# Altium project lga1700.PrjPCB (part 11 of 11)
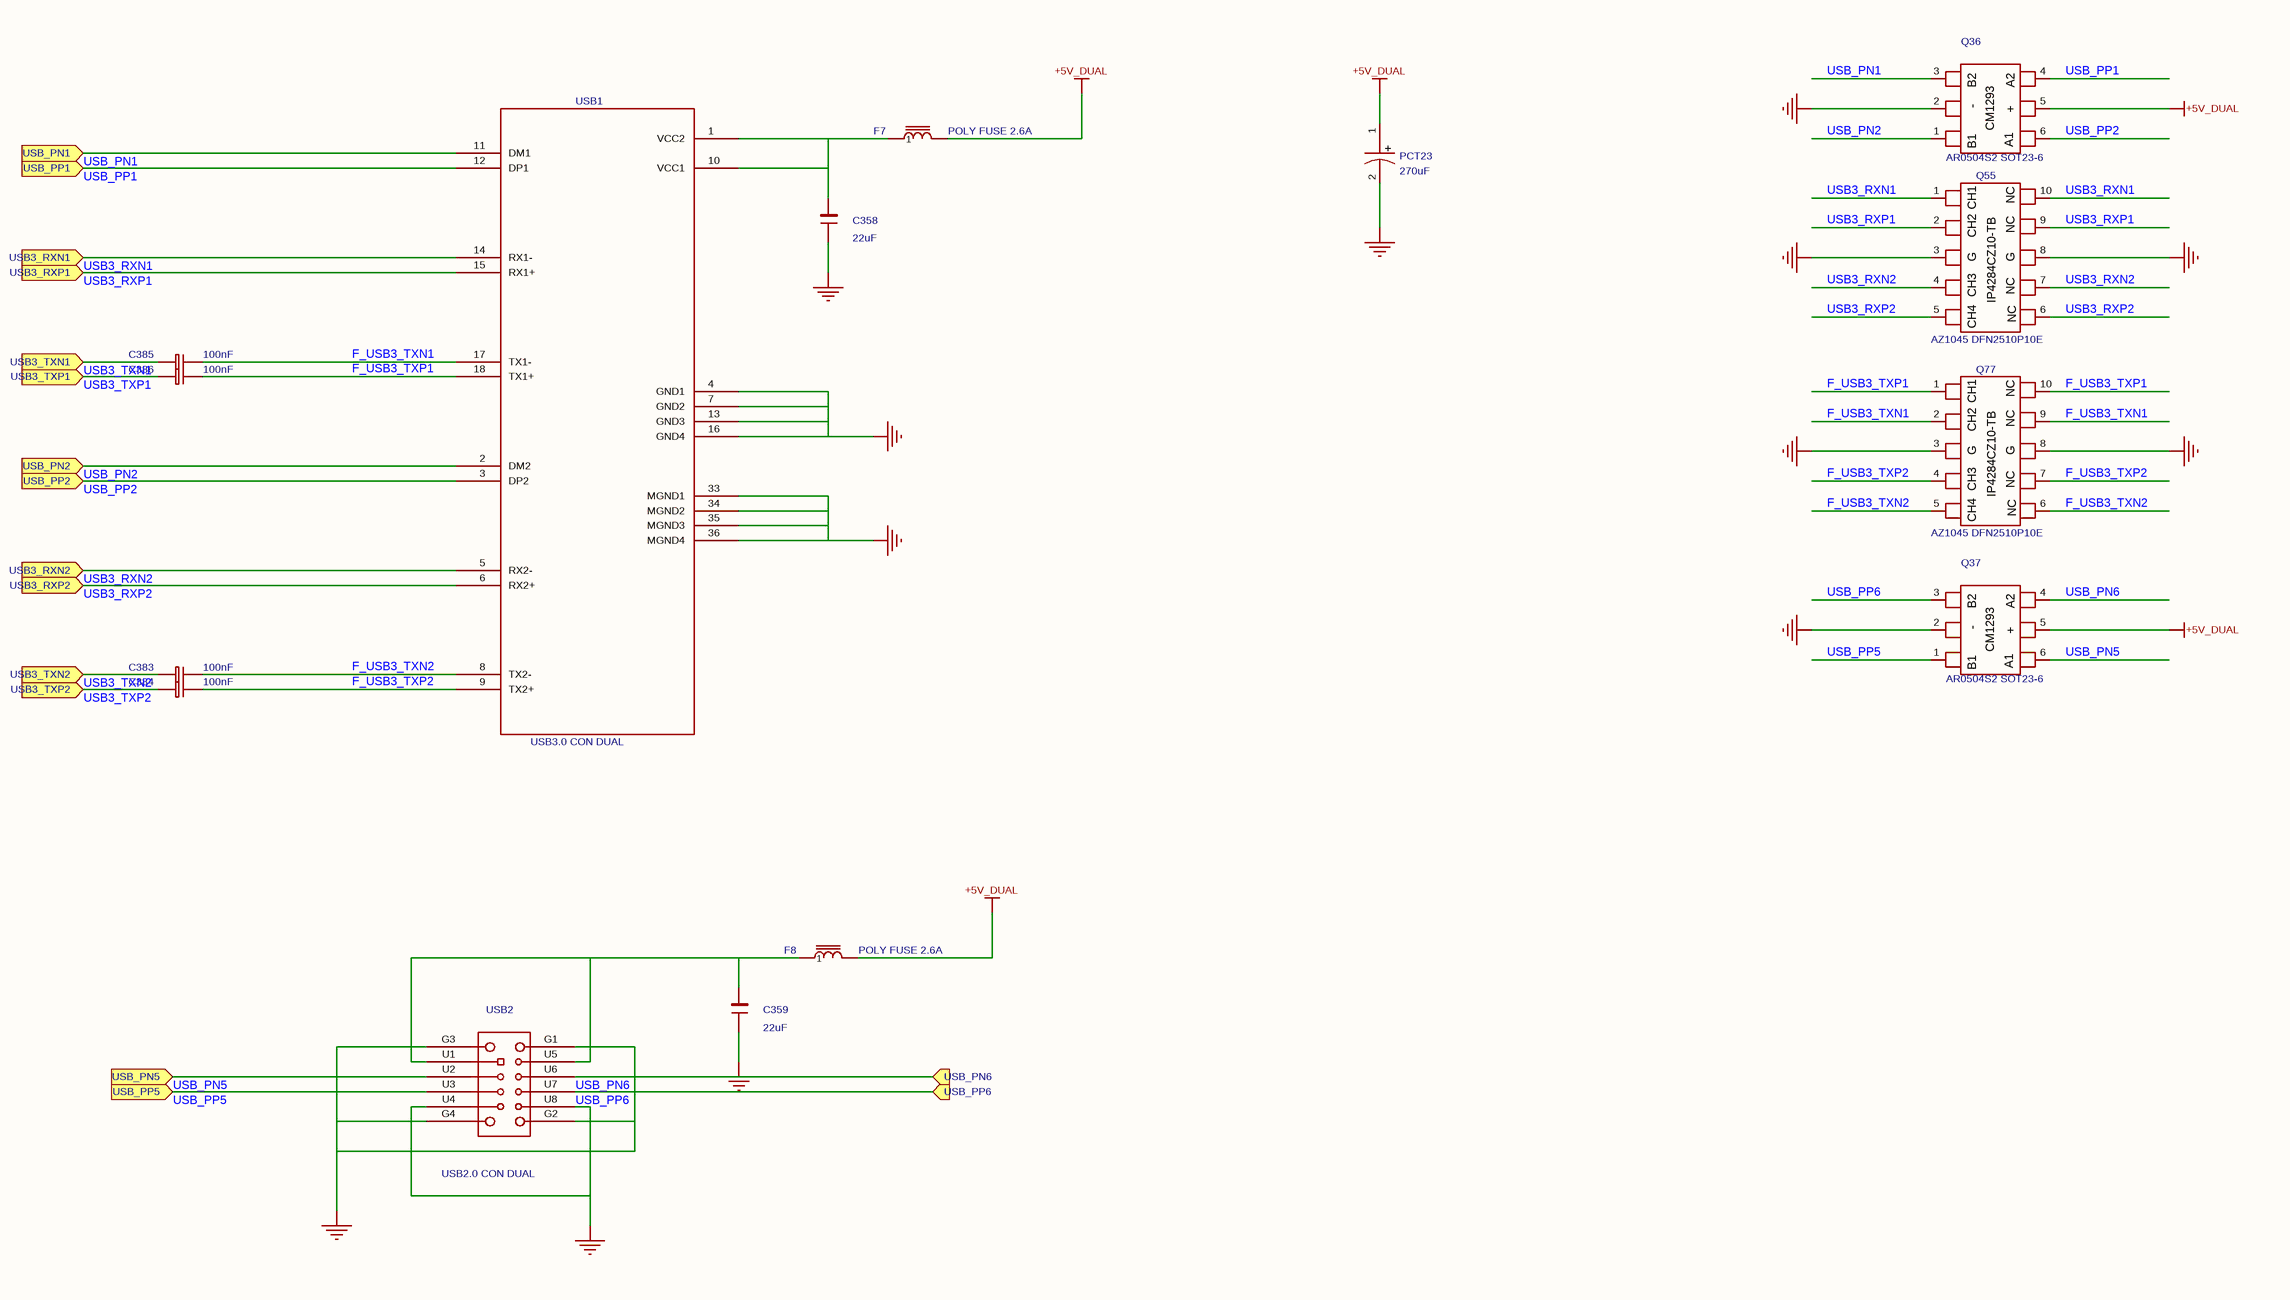
[diagram p134: USB32 GEN1 5G_REAR.schdoc]

## Nets that join several sheets
+3V3_DUAL: 5V_DUAL (5 pins), ADL S PCH 600 PWR (17 pins), ADL S PCH 600 SPI_PM (9 pins), ADL S PCH 600 STRAP (7 pins), DDR4_PWR - +VDDQ_+VTT_+VPP (6 pins), LAN - RTL8111H (LR1.1), PCH_PWR - 0.82V_1.05V_1.8V (8 pins), POWER - SYSTEM POWER (R209.1 R217.1 R218.1 R593.2), SIO - IT8613E (11 pins), SIO - IT8784E (R139.1 R172.1 R194.1 R305.1)
+5V_DUAL: 5V_DUAL (10 pins), CPU_PWR - 1.8V_1.05V (R371.1), CPU_PWR - VCCIN_AUX (R392.2), DDR4_PWR - +VDDQ_+VTT_+VPP (12 pins), PCH_PWR - 0.82V_1.05V_1.8V (6 pins), PEG_PCIEX1 SLOT (C245.1 PR193.1 PU9.3 PU9.4), POWER - SYSTEM POWER (C107.1), SIO - IT8613E (SR31.1), USB32 GEN1 5G_FRONT (7 pins), USB32 GEN1 5G_REAR (5 pins)
+5V_STBY: 5V_DUAL (D2.1 D5.1 R87.1), POWER - SYSTEM POWER (ATXPWR1.9 ECT6.1 FC5.1 R115.1)
+V3.3A_RTC: ADL S PCH 600 PWR (6 pins), ADL S PCH 600 SPI_PM (5 pins), SIO - IT8613E (C273.2 SU3.29)
+VCC1P05_PROC: ADL S PCH 600 SPI_PM (YR39.2 YR42.2 YR43.2), CPU_PWR - 1.8V_1.05V (6 pins)
+VCCCORE: CPU_PWR - +VCCCORE_1_3 (11 pins), CPU_PWR - +VCCCORE_2_3 (PL12.2 PL13.2 PR40.2 PR45.2), CPU_PWR - +VCCCORE_3_3 (PL14.2 PR52.2), SIO - IT8613E (SR28.1)
+VCCPRIM_1P05V: ADL S PCH 600 PWR (BYC4.1 PCH2.AD15), ADL S PCH 600 STRAP (YR86.1), PCH_PWR - 0.82V_1.05V_1.8V (C382.1 R375.2 U12.5)
+VCCPRIM_1P8V: ADL S PCH 600 PWR (9 pins), ADL S PCH 600 STRAP (YR87.2), PCH_PWR - 0.82V_1.05V_1.8V (5 pins), SIO - IT8613E (SR38.1)
+VCCPRIM_P82V: ADL S PCH 600 PWR (55 pins), PCH_PWR - 0.82V_1.05V_1.8V (MCT12.1 PL20.2 PR183.2 TR38.2)
+VPP: DDR4_PWR - +VDDQ_+VTT_+VPP (5 pins), DDR4_UDIMM CHANNEL-A0 (7 pins), DDR4_UDIMM CHANNEL-B0 (7 pins)
+VTT: DDR4_PWR - +VDDQ_+VTT_+VPP (C496.1 PU5.4), DDR4_UDIMM CHANNEL-A0 (C77.1 C78.1 DIMMA1.77 DIMMA1.221), DDR4_UDIMM CHANNEL-B0 (C91.1 C92.1 DIMMB1.77 DIMMB1.221)
GND: 5V_DUAL (9 pins), ADL S PCH 600 CLOCK_PCIE (6 pins), ADL S PCH 600 PWR (30 pins), ADL S PCH 600 SPI_PM (28 pins), ADL S PCH 600 STRAP (YR84.1 YR187.2), AUDIO - ALC897_3CH (11 pins), COM (13 pins), CPU_PWR - +VCCCORE_1_3 (25 pins), CPU_PWR - +VCCCORE_2_3 (18 pins), CPU_PWR - +VCCCORE_3_3 (9 pins), CPU_PWR - +VCCGT (11 pins), CPU_PWR - 1.8V_1.05V (18 pins), CPU_PWR - VCCIN_AUX (16 pins), DDR4_PWR - +VDDQ_+VTT_+VPP (34 pins), DDR4_UDIMM CHANNEL-A0 (117 pins), DDR4_UDIMM CHANNEL-B0 (113 pins), DISPLAY - HDMI 2.0 (17 pins), LAN - RTL8111H (24 pins), M.2_SATA_SLOT (40 pins), PCH_PWR - 0.82V_1.05V_1.8V (26 pins), PEG_PCIEX1 SLOT (91 pins), POWER - SYSTEM POWER (122 pins), SIO - IT8613E (10 pins), SIO - IT8784E (6 pins), USB32 GEN1 5G_FRONT (21 pins), USB32 GEN1 5G_REAR (23 pins)
V12MOS: CPU_PWR - +VCCCORE_1_3 (8 pins), CPU_PWR - +VCCCORE_2_3 (8 pins), CPU_PWR - +VCCCORE_3_3 (PC181.2 PCT11.1 PQ15.5 PR230.1), CPU_PWR - +VCCGT (PC184.2 PCT12.1 PQ17.5 PR231.1), CPU_PWR - VCCIN_AUX (MCT20.1 PC32.2 PQ28.5)
V_SM: DDR4_PWR - +VDDQ_+VTT_+VPP (9 pins), DDR4_UDIMM CHANNEL-A0 (47 pins), DDR4_UDIMM CHANNEL-B0 (45 pins), SIO - IT8613E (SR40.1)
VCC3_3: ADL S PCH 600 CLOCK_PCIE (R53.1 R54.1 R56.1), AUDIO - ALC897_3CH (AFB8.1 R276.2), CPU_PWR - 1.8V_1.05V (7 pins), CPU_PWR - VCCIN_AUX (R393.2 R610.1 R611.1), DDR4_PWR - +VDDQ_+VTT_+VPP (R551.1), DDR4_UDIMM CHANNEL-A0 (C79.1 DIMMA1.284), DDR4_UDIMM CHANNEL-B0 (C93.1 DIMMB1.284 R29.1), DISPLAY - HDMI 2.0 (7 pins), LAN - RTL8111H (LR4.1), M.2_SATA_SLOT (19 pins), PEG_PCIEX1 SLOT (8 pins), POWER - SYSTEM POWER (11 pins), SIO - IT8613E (8 pins), SIO - IT8784E (R140.1 R337.1)
VCC5: 5V_DUAL (ECT11.1 PQ19.1 PQ19.2 PQ19.3), AUDIO - ALC897_3CH (AFB1.1 AFB9.1), COM (R794.1 SU4.20), CPU_PWR - 1.8V_1.05V (PC28.2 PC31.2 PU3.4 PU4.4), CPU_PWR - VCCIN_AUX (MR110.2), DISPLAY - HDMI 2.0 (PD3.2), POWER - SYSTEM POWER (6 pins), SIO - IT8613E (SR36.1)
VCC12: 5V_DUAL (R73.1), COM (C635.2 CPU_FAN.2 R788.1 SU4.1), PEG_PCIEX1 SLOT (13 pins), POWER - SYSTEM POWER (ATXPWR1.10 ATXPWR1.11 FC1.1), SIO - IT8613E (SR30.1)
VCC12-: COM (SU4.10), POWER - SYSTEM POWER (ATXPWR1.14)
1P05_PROC_PGD: CPU_PWR - 1.8V_1.05V (PR17.1 PU4.1), CPU_PWR - VCCIN_AUX (PD7.1)
+3P3V_ALW_PGD: 5V_DUAL (MR2.2 U16.4), ADL S PCH 600 SPI_PM (R102.2), PCH_PWR - 0.82V_1.05V_1.8V (PR24.1)
CLK_PCIE0: ADL S PCH 600 CLOCK_PCIE (PCH2.R9), PEG_PCIEX1 SLOT (PEX16_1.A13)
CLK_PCIE0#: ADL S PCH 600 CLOCK_PCIE (PCH2.R11), PEG_PCIEX1 SLOT (PEX16_1.A14)
CLK_PCIE1: ADL S PCH 600 CLOCK_PCIE (PCH2.N6), LAN - RTL8111H (U5.15)
CLK_PCIE1#: ADL S PCH 600 CLOCK_PCIE (PCH2.P8), LAN - RTL8111H (U5.16)
CLK_PCIE3: ADL S PCH 600 CLOCK_PCIE (PCH2.V9), PEG_PCIEX1 SLOT (PCIEX1_1.A13)
CLK_PCIE3#: ADL S PCH 600 CLOCK_PCIE (PCH2.V11), PEG_PCIEX1 SLOT (PCIEX1_1.A14)
CLK_PCIE6: ADL S PCH 600 CLOCK_PCIE (PCH2.Y15), M.2_SATA_SLOT (SSD2.55)
CLK_PCIE6#: ADL S PCH 600 CLOCK_PCIE (PCH2.Y13), M.2_SATA_SLOT (SSD2.53)
CORE_VID_0: CPU_PWR - 1.8V_1.05V (R368.1), CPU_PWR - VCCIN_AUX (PD8.1)
CTS1#: COM (SU4.14), SIO - IT8613E (SU3.63)
DBG_PMODE: ADL S PCH 600 SPI_PM (PCH2.AF3), ADL S PCH 600 STRAP (YR86.2)
DCD1#: COM (SU4.19), SIO - IT8613E (SU3.61)
DIMMA_VREF_CA: DDR4_UDIMM CHANNEL-A0 (5 pins), DDR4_UDIMM CHANNEL-B0 (DIMMB1.146)
DPWROK: ADL S PCH 600 SPI_PM (R100.2), SIO - IT8613E (SU3.7)
DRAM_RST#: ADL S PCH 600 SPI_PM (PCH2.AM9), DDR4_UDIMM CHANNEL-A0 (DIMMA1.58 R27.2), DDR4_UDIMM CHANNEL-B0 (DIMMB1.58)
DSR1#: COM (SU4.18), SIO - IT8613E (SU3.57)
DTR1#: COM (SU4.13), SIO - IT8613E (SU3.60)
FAN1_CTL: COM (R791.1 R794.2), SIO - IT8613E (SU3.2)
FAN1_TACH: COM (R789.1 R790.2), SIO - IT8613E (SU3.1)
GPD_7: ADL S PCH 600 SPI_PM (PCH2.AK6), ADL S PCH 600 STRAP (YR187.1)
IO_PME#: ADL S PCH 600 STRAP (YR111.1), SIO - IT8613E (SU3.32)
M2_1_DAS: M.2_SATA_SLOT (SSD2.10), POWER - SYSTEM POWER (D4.2 R145.1)
NetATXPWR1_8: 5V_DUAL (R67.1), POWER - SYSTEM POWER (ATXPWR1.8), SIO - IT8613E (SU3.6)
NetPCH2_AN4: ADL S PCH 600 SPI_PM (PCH2.AN4), SIO - IT8613E (SU3.35)
NetSU3_58: COM (SU4.15), SIO - IT8613E (SU3.58)
PCIE1_RXN: ADL S PCH 600 CLOCK_PCIE (PCH2.BD20), LAN - RTL8111H (C240.1)
PCIE1_RXP: ADL S PCH 600 CLOCK_PCIE (PCH2.BB20), LAN - RTL8111H (C239.1)
PCIE1_TXN: ADL S PCH 600 CLOCK_PCIE (PCH2.BF20), LAN - RTL8111H (C238.1)
PCIE1_TXP: ADL S PCH 600 CLOCK_PCIE (PCH2.BE20), LAN - RTL8111H (C237.1)
PCIE2_RXN: ADL S PCH 600 CLOCK_PCIE (PCH2.AR21), PEG_PCIEX1 SLOT (PCIEX1_1.A17)
PCIE2_RXP: ADL S PCH 600 CLOCK_PCIE (PCH2.AT21), PEG_PCIEX1 SLOT (PCIEX1_1.A16)
PCIE2_TXN: ADL S PCH 600 CLOCK_PCIE (PCH2.BF21), PEG_PCIEX1 SLOT (YC60.1)
PCIE2_TXP: ADL S PCH 600 CLOCK_PCIE (PCH2.BG21), PEG_PCIEX1 SLOT (YC59.1)
PCIE5_RXN: ADL S PCH 600 CLOCK_PCIE (PCH2.BA24), M.2_SATA_SLOT (PU16.14)
PCIE5_RXP: ADL S PCH 600 CLOCK_PCIE (PCH2.AW24), M.2_SATA_SLOT (PU16.15)
PCIE5_TXN: ADL S PCH 600 CLOCK_PCIE (PCH2.BJ25), M.2_SATA_SLOT (EC120.2)
PCIE5_TXP: ADL S PCH 600 CLOCK_PCIE (PCH2.BH24), M.2_SATA_SLOT (EC87.2)
PCIE6_RXN: ADL S PCH 600 CLOCK_PCIE (PCH2.AR25), M.2_SATA_SLOT (SSD2.29)
PCIE6_RXP: ADL S PCH 600 CLOCK_PCIE (PCH2.AT25), M.2_SATA_SLOT (SSD2.31)
PCIE6_TXN: ADL S PCH 600 CLOCK_PCIE (PCH2.BG26), M.2_SATA_SLOT (EC57.1)
PCIE6_TXP: ADL S PCH 600 CLOCK_PCIE (PCH2.BF26), M.2_SATA_SLOT (EC110.1)
PCIE7_RXN: ADL S PCH 600 CLOCK_PCIE (PCH2.BE27), M.2_SATA_SLOT (SSD2.17)
PCIE7_RXP: ADL S PCH 600 CLOCK_PCIE (PCH2.BD27), M.2_SATA_SLOT (SSD2.19)
PCIE7_TXN: ADL S PCH 600 CLOCK_PCIE (PCH2.BF27), M.2_SATA_SLOT (EC115.1)
PCIE7_TXP: ADL S PCH 600 CLOCK_PCIE (PCH2.BG27), M.2_SATA_SLOT (EC112.1)
PCIE8_RXN: ADL S PCH 600 CLOCK_PCIE (PCH2.BA27), M.2_SATA_SLOT (SSD2.5)
PCIE8_RXP: ADL S PCH 600 CLOCK_PCIE (PCH2.AW27), M.2_SATA_SLOT (SSD2.7)
PCIE8_TXN: ADL S PCH 600 CLOCK_PCIE (PCH2.BJ28), M.2_SATA_SLOT (EC116.1)
PCIE8_TXP: ADL S PCH 600 CLOCK_PCIE (PCH2.BH28), M.2_SATA_SLOT (EC119.1)
PCIE_RST#: LAN - RTL8111H (U5.19), M.2_SATA_SLOT (SSD2.50), PEG_PCIEX1 SLOT (PCIEX1_1.A11 PEX16_1.A11), SIO - IT8613E (SU3.14)
PCIE_WAKE#: ADL S PCH 600 SPI_PM (PCH2.AT13 YR176.1), LAN - RTL8111H (U5.21), PEG_PCIEX1 SLOT (PCIEX1_1.B11 PEX16_1.B11)
PM_PWRBTN#: ADL S PCH 600 SPI_PM (PCH2.AK8), SIO - IT8613E (SU3.31)
PS_ON_SIO: POWER - SYSTEM POWER (ATXPWR1.16 Q65.3 R115.2), SIO - IT8613E (Q132.1 SU3.34)
PWR_BTN#: POWER - SYSTEM POWER (JFP1.6 PD6.1 R593.1), SIO - IT8613E (SR59.1 SU3.33)
RI1#: COM (SU4.12), SIO - IT8613E (SU3.62)
RSMRST#: ADL S PCH 600 SPI_PM (PCH2.AT15 R95.2), PCH_PWR - 0.82V_1.05V_1.8V (U45.4), POWER - SYSTEM POWER (R507.1), SIO - IT8613E (SC37.2 SR244.2 SU3.43)
RTS1#: COM (SU4.16), SIO - IT8613E (SU3.56)
SATA_RXN3: ADL S PCH 600 CLOCK_PCIE (PCH2.AR37), M.2_SATA_SLOT (EC39.2)
SATA_RXN4: ADL S PCH 600 CLOCK_PCIE (PCH2.BB41), M.2_SATA_SLOT (EC28.2)
SATA_RXN5: ADL S PCH 600 CLOCK_PCIE (PCH2.BA32), M.2_SATA_SLOT (EC43.2)
SATA_RXP3: ADL S PCH 600 CLOCK_PCIE (PCH2.AT37), M.2_SATA_SLOT (EC40.2)
SATA_RXP4: ADL S PCH 600 CLOCK_PCIE (PCH2.BD42), M.2_SATA_SLOT (EC27.2)
SATA_RXP5: ADL S PCH 600 CLOCK_PCIE (PCH2.AW32), M.2_SATA_SLOT (EC44.2)
SATA_TXN3: ADL S PCH 600 CLOCK_PCIE (PCH2.BG42), M.2_SATA_SLOT (EC38.2)
SATA_TXN4: ADL S PCH 600 CLOCK_PCIE (PCH2.BG44), M.2_SATA_SLOT (EC26.2)
SATA_TXN5: ADL S PCH 600 CLOCK_PCIE (PCH2.BH36), M.2_SATA_SLOT (EC42.2)
SATA_TXP3: ADL S PCH 600 CLOCK_PCIE (PCH2.BF43), M.2_SATA_SLOT (EC37.2)
SATA_TXP4: ADL S PCH 600 CLOCK_PCIE (PCH2.BF44), M.2_SATA_SLOT (EC25.2)
SATA_TXP5: ADL S PCH 600 CLOCK_PCIE (PCH2.BJ36), M.2_SATA_SLOT (EC41.2)
SIN1: COM (SU4.17), SIO - IT8613E (SU3.59)
SLP_S3_N: ADL S PCH 600 SPI_PM (PCH2.AP4 YR139.1), CPU_PWR - 1.8V_1.05V (R369.1), POWER - SYSTEM POWER (R522.1), SIO - IT8613E (SU3.30)
SLP_S4_N: ADL S PCH 600 SPI_PM (PCH2.AM11 YR138.1), DDR4_PWR - +VDDQ_+VTT_+VPP (SR27.1)
SLP_SUS#: ADL S PCH 600 SPI_PM (PCH2.AR11 YR140.1), PCH_PWR - 0.82V_1.05V_1.8V (MR13.1)
SMB_CLK: DDR4_UDIMM CHANNEL-A0 (DIMMA1.141), DDR4_UDIMM CHANNEL-B0 (DIMMB1.141), PEG_PCIEX1 SLOT (PCIEX1_1.B5 PEX16_1.B5)
SMB_DATA: DDR4_UDIMM CHANNEL-A0 (DIMMA1.285), DDR4_UDIMM CHANNEL-B0 (DIMMB1.285), PEG_PCIEX1 SLOT (PCIEX1_1.B6 PEX16_1.B6)
SPI_MOSI: ADL S PCH 600 SPI_PM (PCH2.AK48 U18.5), ADL S PCH 600 STRAP (YR45.1)
SRCCLKREQ0#: ADL S PCH 600 CLOCK_PCIE (PCH2.AG4 R53.2), PEG_PCIEX1 SLOT (PEX16_1.B17 PEX16_1.B31 PEX16_1.B48 PEX16_1.B81)
SRCCLKREQ3#: ADL S PCH 600 CLOCK_PCIE (PCH2.AK5 R54.2), PEG_PCIEX1 SLOT (PCIEX1_1.B17)
SRCCLKREQ6#: ADL S PCH 600 CLOCK_PCIE (PCH2.AD18 R56.2), M.2_SATA_SLOT (SSD2.52)
SYS_RST#: ADL S PCH 600 SPI_PM (PCH2.AU52), POWER - SYSTEM POWER (JFP1.7 R425.1)